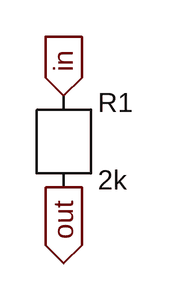
[diagram p0: schematic child.asc]
child.asc, the LTspice schematic file:
Version 4
SHEET 1 800 600
FLAG 112 112 in
IOPIN 112 112 In
FLAG 112 192 out
IOPIN 112 192 Out
SYMBOL res 96 96 R0
SYMATTR InstName R1
SYMATTR Value 2k

The netlist it stands for:
* child.asc
R1 in out 2k
.backanno
.end